# Altium schematic sheet BOOT_MODE_BUFFER&SWITCHES.SchDoc
size A4; SheetNumber: 11; SheetTotal: 18
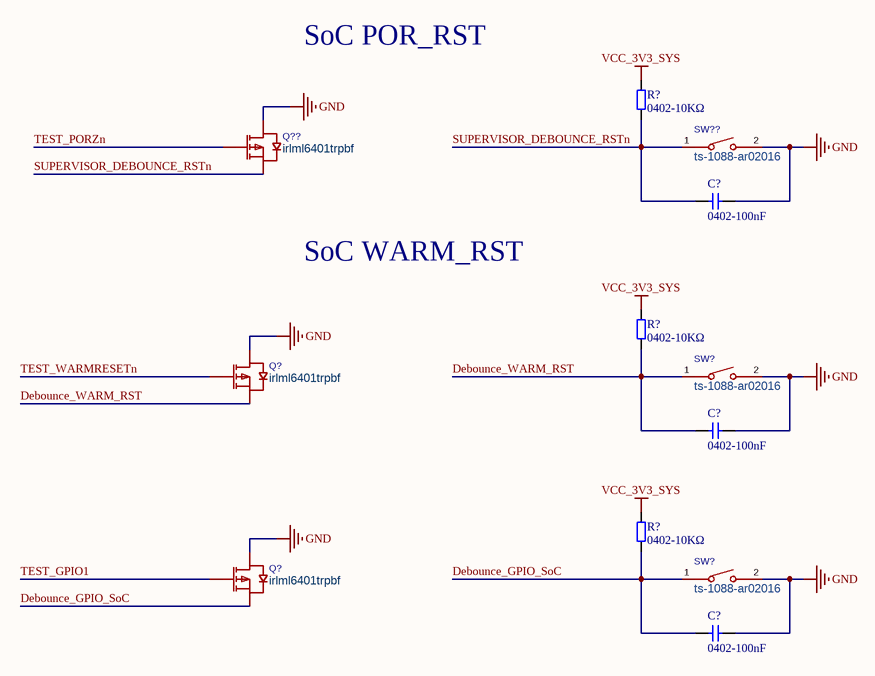
[diagram p0: BOOT_MODE_BUFFER&SWITCHES.SchDoc]

## Parts
(Parts that share a designator on the sheet are numbered #1, #2 ... from top to bottom, then left to right.)
C?#1  0402-100nF  [C0402]
C?#2  0402-100nF  [C0402]
C?#3  0402-100nF  [C0402]
Q?#1  irlml6401trpbf  [SOT-23-3_L2.9-W1.3-P1.90-LS2.4-BR]
Q?#2  irlml6401trpbf  [SOT-23-3_L2.9-W1.3-P1.90-LS2.4-BR]
Q??  irlml6401trpbf  [SOT-23-3_L2.9-W1.3-P1.90-LS2.4-BR]
R?#1  0402-10KΩ  [R0402]
R?#2  0402-10KΩ  [R0402]
R?#3  0402-10KΩ  [R0402]
SW?#1  ts-1088-ar02016  [SW-SMD_L3.9-W3.0-P4.45]
SW?#2  ts-1088-ar02016  [SW-SMD_L3.9-W3.0-P4.45]
SW??  ts-1088-ar02016  [SW-SMD_L3.9-W3.0-P4.45]

## Nets
GND: C?#1.2 C?#2.2 C?#3.2 Q?#1.3(D) Q?#2.3(D) Q??.3(D) SW?#1.2 SW?#2.2 SW??.2
VCC_3V3_SYS: R?#1.2 R?#2.2 R?#3.2
Debounce_GPIO_SoC: C?#3.1 Q?#2.2(S) R?#3.1 SW?#2.1
Debounce_WARM_RST: C?#2.1 Q?#1.2(S) R?#2.1 SW?#1.1
SUPERVISOR_DEBOUNCE_RSTn: C?#1.1 Q??.2(S) R?#1.1 SW??.1
TEST_GPIO1: Q?#2.1(G)
TEST_PORZn: Q??.1(G)
TEST_WARMRESETn: Q?#1.1(G)

## Notes on the sheet
- SoC POR_RST
- SoC WARM_RST

## Library data of the parts
C?#1-C?#3 = C0402: 物料号: *; 物料描述: *
Q?#1 Q?#2 Q?? = irlml6401trpbf: 数量:1个P沟道;漏源电压(Vdss):12V;连续漏极电流(Id):4.3A;导通电阻(RDS(on)):50mΩ@4.5V;耗散功率(Pd):1.3W;阈值电压(Vgs(th)):950mV;; Manufacturer: Infineon(英飞凌); AddInBom: yes; ModelId: c62791f0466c4ae2a892c056b845b0ca; ModelName: SOT-23-3P_L2.9-W1.3-H1.0-LS2.4-P0.95; ModelTransform: 98.425,114.173,0,180,0,0,0.0005,-0.0005,0; Number: 1个P沟道; Drain to Source Voltage: 12V; Current - Continuous Drain(Id): 4.3A; Pd - Power Dissipation: 1.3W; Gate Threshold Voltage (Vgs(th)): 950mV; Gate Charge(Qg): 15nC@5V; Input Capacitance(Ciss): 830pF; Reverse Transfer Capacitance (Crss@Vds): 125pF; Type: P沟道; Output Capacitance(Coss): 180pF; Vgs: ±8V; Symbol: IRLML6401TRPBF; LCSC Part Name: 1个P沟道 耐压:12V 电流:4.3A; SupplierPart: C3034; ManufacturerPart: IRLML6401TRPBF; Supplier Footprint: SOT-23; JLCPCB Part Class: Extended Part; Datasheet: https://item.szlcsc.com/datasheet/IRLML6401TRPBF/3416.html; Supplier: LCSC; ConvertToPcb: yes; FootprintName: SOT-23-3_L2.9-W1.3-P1.90-LS2.4-BR; RDS(on): 50mΩ@4.5V; Operating Temperature: -55℃~+150℃; Configuration: -
R?#1-R?#3 = R0402: 片式电阻; 物料描述: 片式电阻器-0805-10KΩ-5%-JT; 物料号: NA
SW?#1 SW?#2 SW?? = ts-1088-ar02016: 电路结构:单刀单掷;按钮形状:圆形按钮;作用力:1.6N;安装方式:立贴;开关长度:3.9mm;开关宽度:3mm;开关高度:2mm;带支架:不带支架;触点电流:50mA;额定电压:12V;带灯:-;工作寿命:10万次;; Manufacturer: XUNPU(讯普); AddInBom: yes; ModelId: b26698b69f274ffabef8a26c7d0e5dd1; ModelName: SW-SMD_L3.9-W2.9-H2.0-LS4.8; ModelTransform: 188.976,114.174,0,0,0,0,0,0,0; Circuit: 单刀单掷; Actuator Style: 圆形按钮; Operating Force: 1.6N; Switch Height: 2mm; with Bracket: 不带支架; Contact Current: 50mA; Voltage Rating: 12V; Actuator/Cap Color: 黑色; Life: 10万次; Symbol: TS-1088-AR02016; LCSC Part Name: 3.9*3*2mm 立贴 轻触开关; SupplierPart: C720477; ManufacturerPart: TS-1088-AR02016; Supplier Footprint: SMD,4x3mm; JLCPCB Part Class: Basic Part; Datasheet: https://item.szlcsc.com/datasheet/TS-1088-AR02016/763484.html; Supplier: LCSC; ConvertToPcb: yes; FootprintName: SW-SMD_L3.9-W3.0-P4.45; Mounting Type: 立贴; Length: 3.9mm; Width: 3mm; With Lamp: -; IP Rating: -; Termination Style: SMD接片; Operating Temperature: -30℃~+80℃